# Altium schematic sheet TELEX_BLE_RECEIVE_TYPEC_V1.0.SchDoc
size A4; SheetNumber: 1; SheetTotal: 1
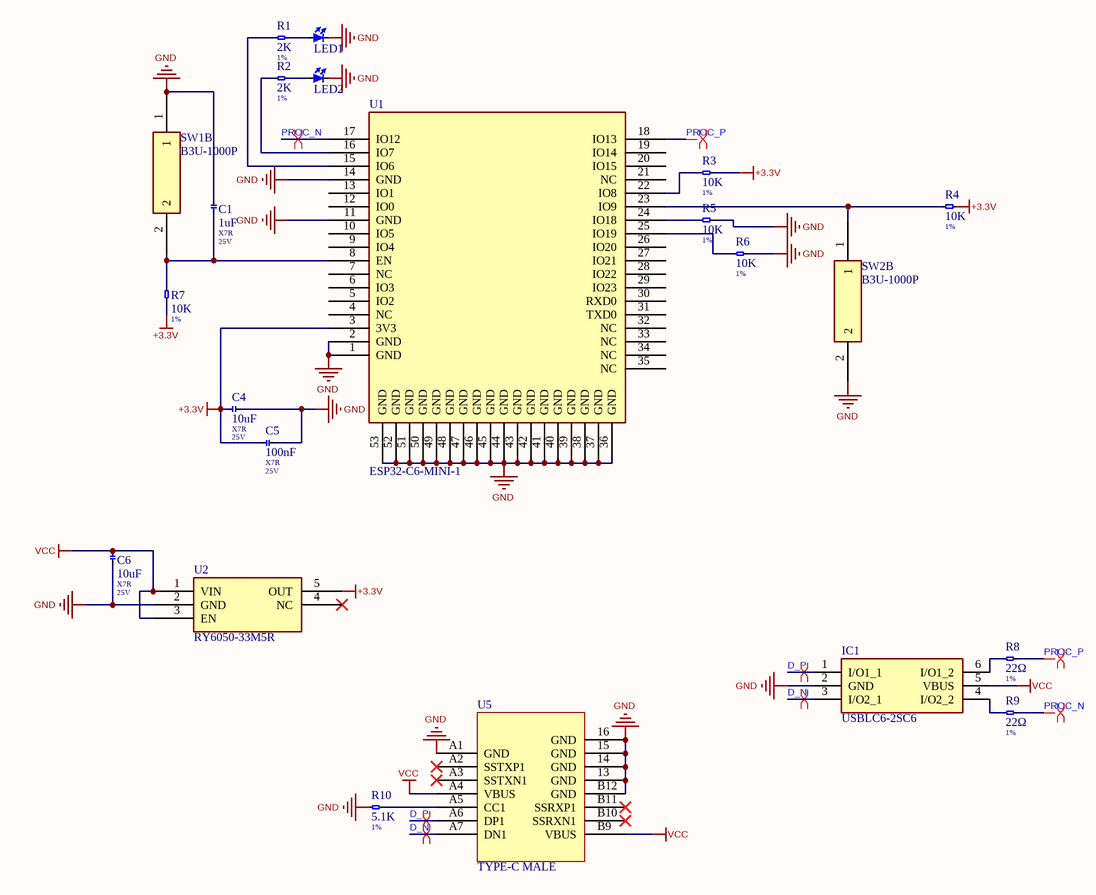
[diagram p0: TELEX_BLE_RECEIVE_TYPEC_V1.0.SchDoc]

## Parts
C1  1uF  材质: X7R  耐压: 25V  [C0603]
C4  10uF  材质: X7R  耐压: 25V  [C0603]
C5  100nF  材质: X7R  耐压: 25V  [C0603]
C6  10uF  材质: X7R  耐压: 25V  [C0603]
IC1  USBLC6-2SC6  [SOT95P280X145-6N]
LED1  LED_BLUE  [LED0603_BLUE]  (value not drawn)
LED2  LED_BLUE  [LED0603_BLUE]  (value not drawn)
R1  2K  精度: 1%  [R0603]
R2  2K  精度: 1%  [R0603]
R3  10K  精度: 1%  [R0603]
R4  10K  精度: 1%  [R0603]
R5  10K  精度: 1%  [R0603]
R6  10K  精度: 1%  [R0603]
R7  10K  精度: 1%  [R0603]
R8  22Ω  精度: 1%  [R0603]
R9  22Ω  精度: 1%  [R0603]
R10  5.1K  精度: 1%  [R0603]
SW1  B3U-1000P  [B3U-1000P]  (part B of 2)
SW2  B3U-1000P  [B3U-1000P]  (part B of 2)
U1  ESP32-C6-MINI-1  [ESP32-C6-MINI-1]
U2  RY6050-33M5R  [SOT95P285X140-5N]
U5  TYPE-C MALE  [USB-C-SMD_TYPE-C-31-G-03]

## Nets
+3.3V: C4.2 C5.2 R3.2 R4.1 R7.1 U1.3(3V3) U2.5(OUT)
GND: C1.2 C4.1 C5.1 C6.2 IC1.2(GND) LED1.2 LED2.2 R5.2 R6.2 R10.1 SW1.1 SW2.2 U1.1(GND) U1.2(GND) U1.11(GND) U1.14(GND) U1.36(GND) U1.37(GND) U1.38(GND) U1.39(GND) U1.40(GND) U1.41(GND) U1.42(GND) U1.43(GND) U1.44(GND) U1.45(GND) U1.46(GND) U1.47(GND) U1.48(GND) U1.49(GND) U1.50(GND) U1.51(GND) U1.52(GND) U1.53(GND) U2.2(GND) U5.13(GND) U5.14(GND) U5.15(GND) U5.16(GND) U5.A1(GND) U5.B12(GND)
VCC: C6.1 IC1.5(VBUS) U2.1(VIN) U2.3(EN) U5.A4(VBUS) U5.B9(VBUS)
D_N: IC1.3(I/O2_1) U5.A7(DN1)
D_P: IC1.1(I/O1_1) U5.A6(DP1)
PROC_N: R9.1 U1.17(IO12)
PROC_P: R8.1 U1.18(IO13)
NetC1_1: C1.1 R7.2 SW1.2 U1.8(EN)
NetIC1_4: IC1.4(I/O2_2) R9.2
NetIC1_6: IC1.6(I/O1_2) R8.2
NetLED1_1: LED1.1 R1.2
NetLED2_1: LED2.1 R2.2
NetR1_1: R1.1 U1.15(IO6)
NetR2_1: R2.1 U1.16(IO7)
NetR3_1: R3.1 U1.22(IO8)
NetR4_2: R4.2 SW2.1 U1.23(IO9)
NetR5_1: R5.1 U1.24(IO18)
NetR6_1: R6.1 U1.25(IO19)
NetR10_2: R10.2 U5.A5(CC1)

Not connected (* = marked no-connect by the designer): U1 4(NC) 5(IO2) 6(IO3) 7(NC) 9(IO4) 10(IO5) 12(IO0) 13(IO1) 19(IO14) 20(IO15) 21(NC) 26(IO20) 27(IO21) 28(IO22) 29(IO23) 30(RXD0) 31(TXD0) 32(NC) 33(NC) 34(NC) 35(NC); U2 4(NC)*; U5 A2(SSTXP1)* A3(SSTXN1)* B10(SSRXN1)* B11(SSRXP1)*

## Layout directives
differential pair: D_N, D_P, PROC_N, PROC_P

## Library data of the parts
C1 C4-C6 = CC: 瓷片电容; 精度: 20%; 品牌: muRata; 类别: 电容
IC1 = USBLC6-2SC6: Integrated Circuit; Manufacturer_Name: STMicroelectronics; Datasheet Link: https://www.st.com/resource/en/datasheet/usblc6-2.pdf; Height: 1.45mm; Manufacturer_Part_Number: USBLC6-2SC6; Mouser Part Number: 511-USBLC6-2SC6; Mouser Price/Stock: https://www.mouser.co.uk/ProductDetail/STMicroelectronics/USBLC6-2SC6?qs=po45yt2pPpu%2FhNIlwQdTlg%3D%3D; Arrow Part Number: USBLC6-2SC6; Arrow Price/Stock: https://www.arrow.com/en/products/usblc6-2sc6/stmicroelectronics.html?utm_currency=USD&region=nac
LED1 LED2 = LED_BLUE: 发光二极管（蓝）
R1-R10 = R: 贴片电阻; 类别: 电阻; 品牌: 国巨; 材质: 薄膜